# EasyEDA Pro project ProPrj_Solar MPPT Charger v4_2026-03-31.epro

# Schematic Solar Converter
Board Name: Solar Converter; Create Date: 2024-10-22; Page Name: Solar Converter; Project Name: Solar MPPT Charger v4; Schematic Name: Solar Converter; Update Date: 2024-10-26; Add into BOM: yes; Company: Your Company; Convert to PCB: yes; Date: 2020-07-08; Draw By: iqasi096; REV: 1.0; Sheet: 1/1
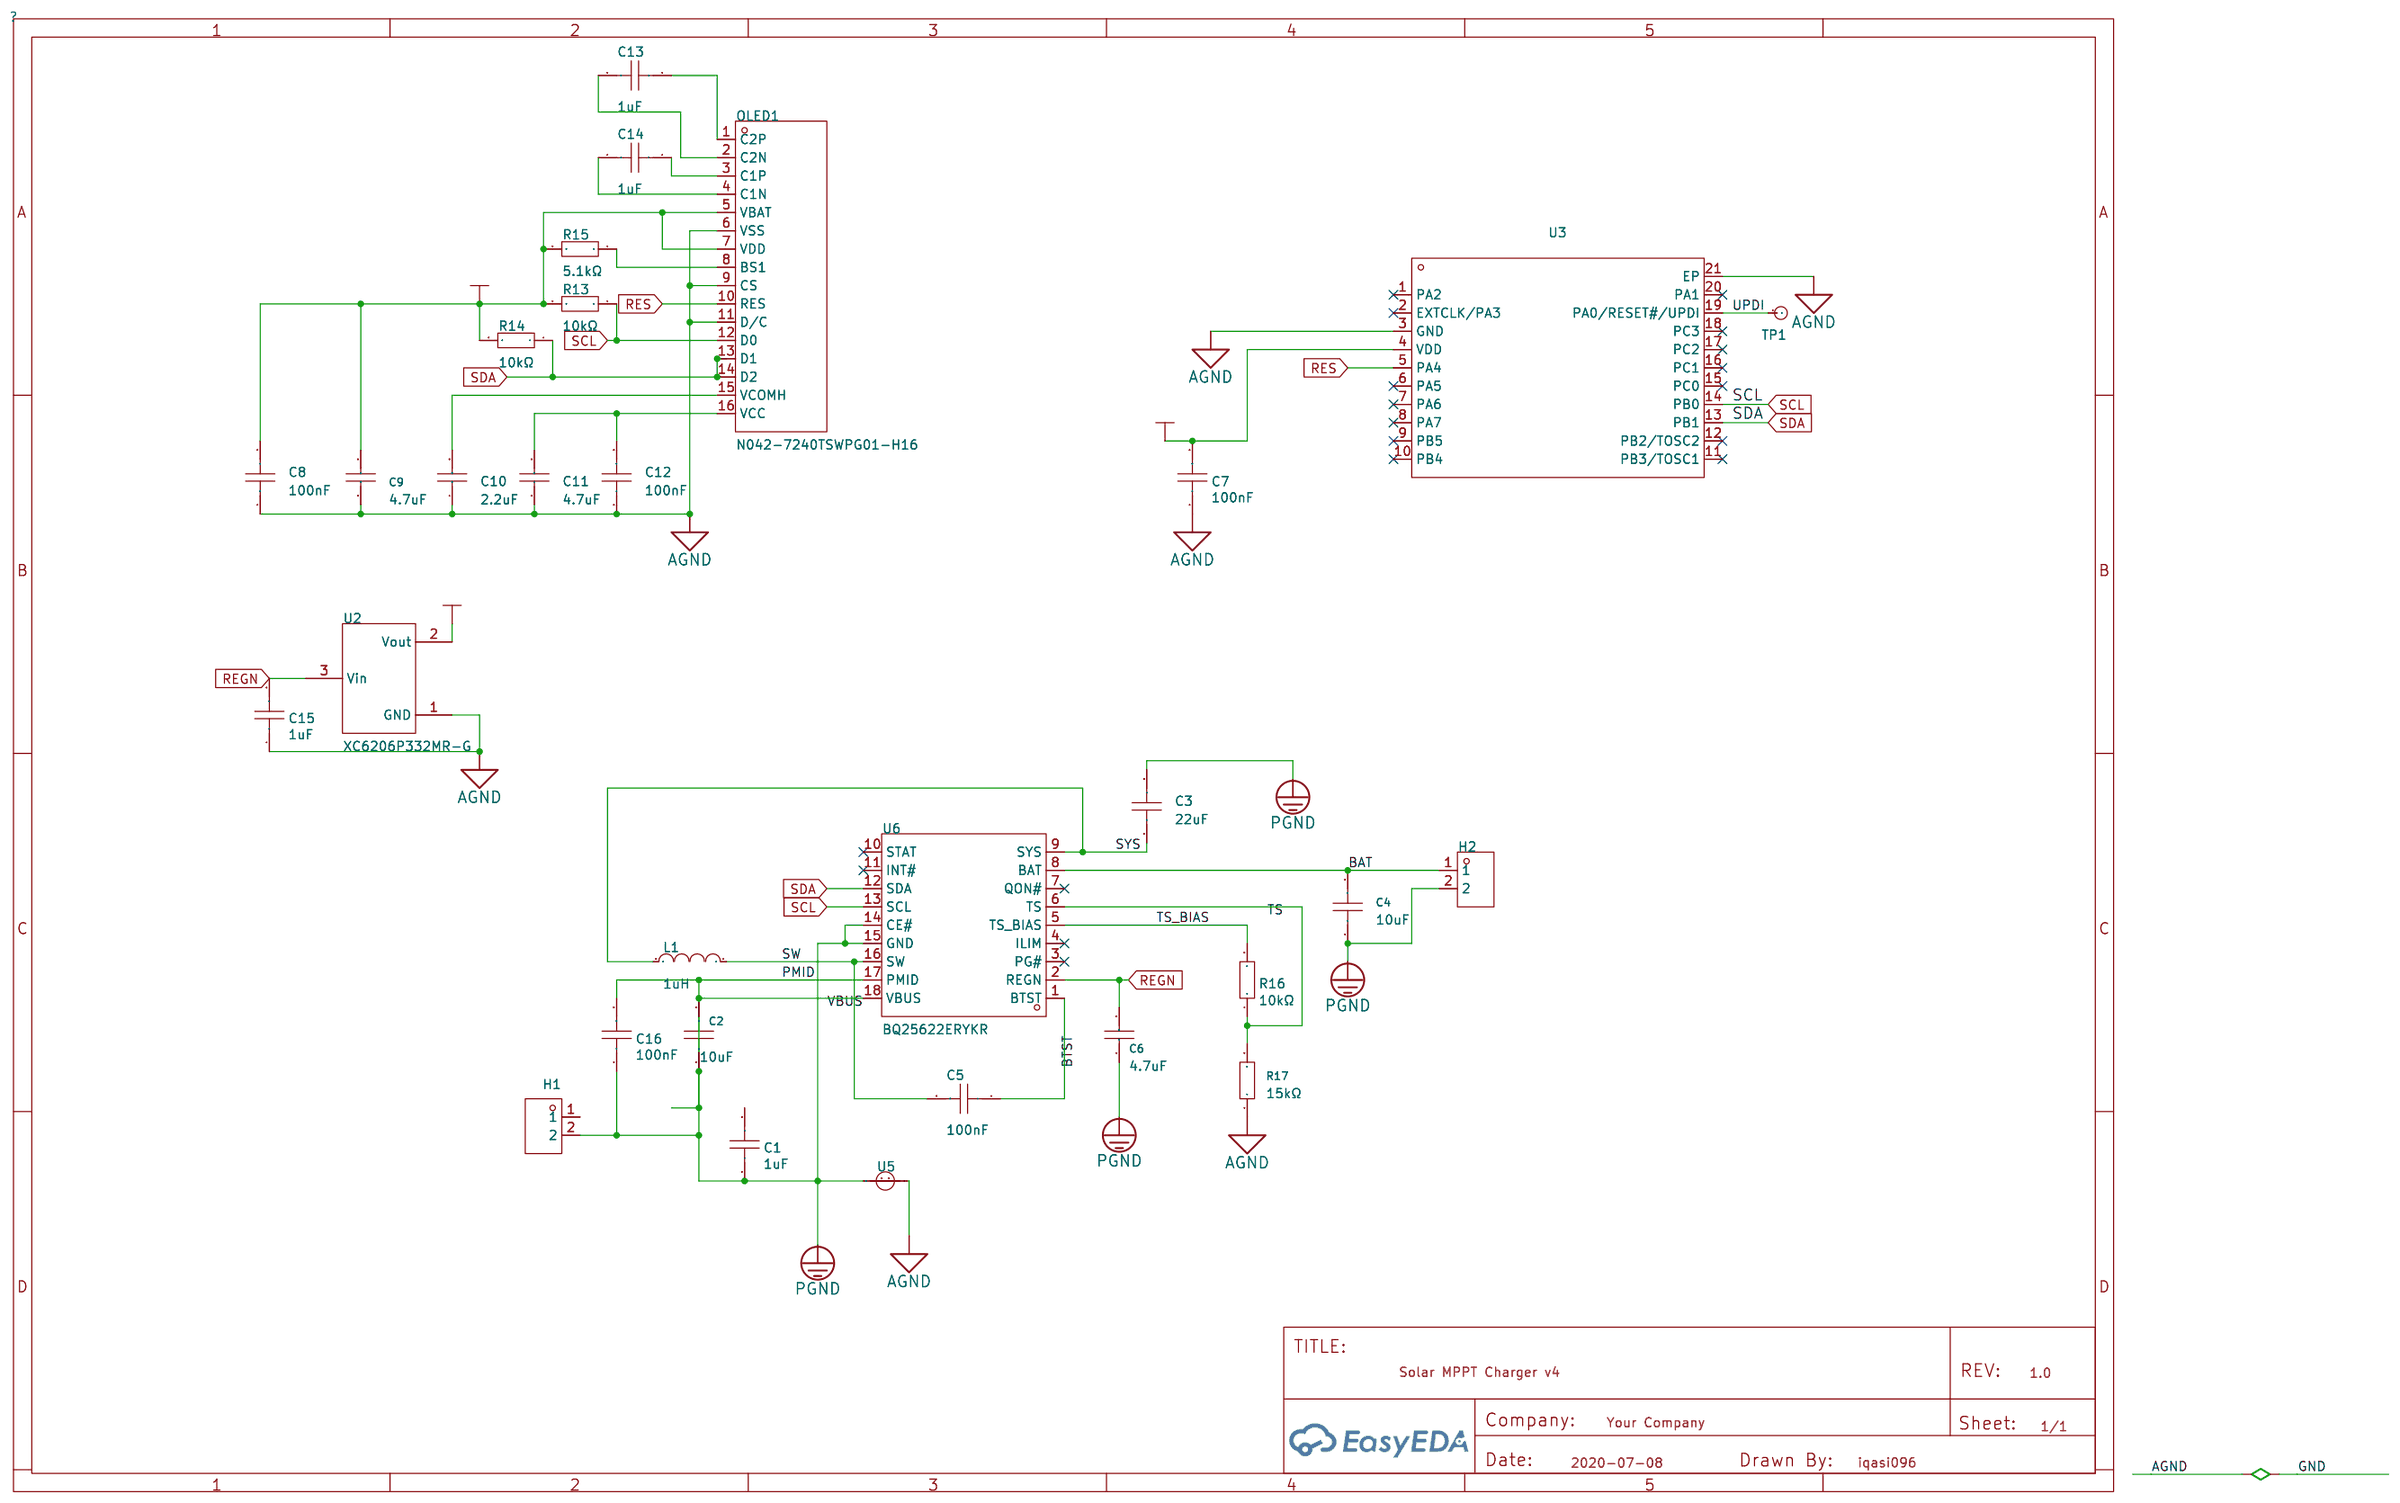
[diagram p0: schematic sheet]

## Parts
C1  1uF  [C0402]
C2  10uF  [C0603]
C3  22uF  [C0805]
C4  10uF  [C0603]
C5  100nF  [C0402]
C6  4.7uF  [C0402]
C7  100nF  [C0402]
C8  100nF  [C0402]
C9  4.7uF  [C0402]
C10  2.2uF  [C0603]
C11  4.7uF  [C0603]
C12  100nF  [C0402]
C13  1uF  [C0402]
C14  1uF  [C0402]
C15  1uF  [C0402]
C16  100nF  [C0402]
H1  SIP2-2.54MM双排针  [footprint_31f8]
H2  SIP2-2.54MM双排针  [footprint_31f8]
L1  1uH  [IND-SMD_L5.4-W5.2_SUMIDA_0530CDMCCDS]
OLED1  N042-7240TSWPG01-H16  [OLED-SMD_L23.0-W12.0_N042-7240TSWPG01-H16]
R13  10kΩ  [R0402]
R14  10kΩ  [R0402]
R15  5.1kΩ  [R0402]
R16  10kΩ  [R0402]
R17  15kΩ  [R0402]
TP1  TESTPOIN-SMD-Ø1.2MM  [footprint_b741]
U2  XC6206P332MR-G  [SOT-23-3_L2.9-W1.6-P1.90-LS2.8-BR]
U3  ATTINY1616-MNR  [footprint_6c4b]
U5  -  [short_keith]  (no BOM)
U6  BQ25622ERYKR  [WQFN-18_L3.0-W2.5-P0.40-TL]

## Library data of the parts
C1 C13-C15 = CL05A105KA5NQNC: Capacitance: Tolerance:±10% Tolerance:±10% Voltage Rated: Temperature Coefficient:; LCSC Part Name: 1uF ±10% 25V; Supplier Part: C52923; Manufacturer: SAMSUNG(三星); Supplier Footprint: 0402; JLCPCB Part Class: Basic Part; Datasheet: https://atta.szlcsc.com/upload/public/pdf/source/20160218/1457707763339.pdf; Supplier: LCSC; Tolerance: ±10%
C2 C4 = CL10A106MA8NRNC: Capacitance: Tolerance:±20% Tolerance:±20% Voltage Rated: Temperature Coefficient:; LCSC Part Name: 10uF ±20% 25V; Supplier Part: C96446; Manufacturer: SAMSUNG(三星); Supplier Footprint: 0603; JLCPCB Part Class: Basic Part; Datasheet: https://atta.szlcsc.com/upload/public/pdf/source/20160218/1457707763339.pdf; Supplier: LCSC; Tolerance: ±20%
C3 = CL21A226MAQNNNE: Capacitance: Tolerance:±20% Tolerance:±20% Voltage Rated: Temperature Coefficient:; LCSC Part Name: 22uF ±20% 25V; Supplier Part: C45783; Manufacturer: SAMSUNG(三星); Supplier Footprint: 0805; JLCPCB Part Class: Basic Part; Datasheet: https://atta.szlcsc.com/upload/public/pdf/source/20160218/1457707763339.pdf; Supplier: LCSC; Tolerance: ±20%
C5 = CL05B104KO5NNNC: Capacitance: Tolerance:±10% Tolerance:±10% Voltage Rated: Temperature Coefficient:; LCSC Part Name: 100nF ±10% 16V; Supplier Part: C1525; Manufacturer: SAMSUNG(三星); Supplier Footprint: 0402; JLCPCB Part Class: Basic Part; Datasheet: https://atta.szlcsc.com/upload/public/pdf/source/20160218/1457707763339.pdf; Supplier: LCSC; Tolerance: ±10%
C6 C9 = CL05A475MP5NRNC: Capacitance: Tolerance:±20% Tolerance:±20% Voltage Rated: Temperature Coefficient:; LCSC Part Name: 4.7uF ±20% 10V; Supplier Part: C23733; Manufacturer: SAMSUNG(三星); Supplier Footprint: 0402; JLCPCB Part Class: Basic Part; Datasheet: https://atta.szlcsc.com/upload/public/pdf/source/20160218/1457707763339.pdf; Supplier: LCSC; Tolerance: ±20%
C7 C8 C12 C16 = CL05B104KB54PNC: Capacitance: Tolerance:±10% Tolerance:±10% Voltage Rated: Temperature Coefficient:; LCSC Part Name: 100nF ±10% 50V; Supplier Part: C307331; Manufacturer: SAMSUNG(三星); Supplier Footprint: 0402; JLCPCB Part Class: Basic Part; Datasheet: https://atta.szlcsc.com/upload/public/pdf/source/20160218/1457707763339.pdf; Supplier: LCSC; Tolerance: ±10%
C10 = CL10A225KO8NNNC: Capacitance: Tolerance:±10% Tolerance:±10% Voltage Rated: Temperature Coefficient:; LCSC Part Name: 2.2uF ±10% 16V; Supplier Part: C23630; Manufacturer: SAMSUNG(三星); Supplier Footprint: 0603; JLCPCB Part Class: Basic Part; Datasheet: https://atta.szlcsc.com/upload/public/pdf/source/20160218/1457707763339.pdf; Supplier: LCSC; Tolerance: ±10%
C11 = CL10A475KO8NNNC: Capacitance: Tolerance:±10% Tolerance:±10% Voltage Rated: Temperature Coefficient:; LCSC Part Name: 4.7uF ±10% 16V; Supplier Part: C19666; Manufacturer: SAMSUNG(三星); Supplier Footprint: 0603; JLCPCB Part Class: Basic Part; Datasheet: https://atta.szlcsc.com/upload/public/pdf/source/20160218/1457707763339.pdf; Supplier: LCSC; Tolerance: ±10%
H1 H2 = SIP2-2.54MM双排针: Supplier: LCSC; Supplier Part: C9900003705; Manufacturer: null; Manufacturer Part: SIP2-2.54mm双排针; JLCPCB Part Class: Extended Part
L1 = 0530CDMCCDS-1R0MC: Inductance: Tolerance:±20% Tolerance:±20% Rated Current: Saturation Current (Isat):12A DC Resistance (DCR): Type:- Ratings:-; LCSC Part Name: 1uH ±20% 12A; Supplier Part: C2453584; Manufacturer: Sumida(胜美达); Supplier Footprint: SMD,5.4x5.2mm; JLCPCB Part Class: Extended Part; Datasheet: https://atta.szlcsc.com/upload/public/pdf/source/20200609/C596466_5BCDC523DFFDD55220635ED057F3408C.pdf; Supplier: LCSC; Tolerance: ±20%; Saturation Current (Isat): 12A
OLED1 = N042-7240TSWPG01-H16: Main Control Chip:SSD1315 Interface Type:I2C Size:0.42 Pixel Resolution:72x40 Operating Temperature:-40℃~+85℃ Operating Temperature:-40℃~+85℃; LCSC Part Name: 0.42寸 白光 72x40像素分辨率 16PIN; Supplier Part: C2890602; Manufacturer: Newvision(新智景); JLCPCB Part Class: Extended Part; Datasheet: https://atta.szlcsc.com/upload/public/pdf/source/20220616/8E4FF058E99944D2E326A1AA19D8CE74.pdf; Supplier: LCSC; Main Control Chip: SSD1315; Interface Type: I2C; Size: 0.42; Pixel Resolution: 72x40; Operating Temperature: -40℃~+85℃
R13 R14 R16 = 0402WGF1002TCE: Type:Thick Film Resistors Resistance:10kΩ Tolerance:±1% Tolerance:±1% Power(Watts): Overload Voltage (Max): Temperature Coefficient:±100ppm/℃ Temperature Coefficient:±100ppm/℃ Operating Temperature Range:-55℃~+155℃ Operating Temperature Range:-55℃~+155℃; LCSC Part Name: 10kΩ ±1% 62.5mW 厚膜电阻; Supplier Part: C25744; Manufacturer: UNI-ROYAL(厚声); Supplier Footprint: 0402; JLCPCB Part Class: Basic Part; Datasheet: https://atta.szlcsc.com/upload/public/pdf/source/20200306/C422600_1E6D84923E4A46A82E41ADD87F860B5C.pdf; Supplier: LCSC; Type: Thick Film Resistors; Tolerance: ±1%; Temperature Coefficient: ±100ppm/℃; Operating Temperature Range: -55℃~+155℃
R15 = 0402WGF5101TCE: Type:Thick Film Resistors Resistance:5.1kΩ Tolerance:±1% Tolerance:±1% Power(Watts): Overload Voltage (Max): Temperature Coefficient:±100ppm/℃ Temperature Coefficient:±100ppm/℃ Operating Temperature Range:-55℃~+155℃ Operating Temperature Range:-55℃~+155℃; LCSC Part Name: 5.1kΩ ±1% 62.5mW 厚膜电阻; Supplier Part: C25905; Manufacturer: UNI-ROYAL(厚声); Supplier Footprint: 0402; JLCPCB Part Class: Basic Part; Datasheet: https://atta.szlcsc.com/upload/public/pdf/source/20200306/C422600_1E6D84923E4A46A82E41ADD87F860B5C.pdf; Supplier: LCSC; Type: Thick Film Resistors; Tolerance: ±1%; Temperature Coefficient: ±100ppm/℃; Operating Temperature Range: -55℃~+155℃
R17 = 0402WGF1502TCE: Type:Thick Film Resistors Resistance:15kΩ Tolerance:±1% Tolerance:±1% Power(Watts): Overload Voltage (Max): Temperature Coefficient:±100ppm/℃ Temperature Coefficient:±100ppm/℃ Operating Temperature Range:-55℃~+155℃ Operating Temperature Range:-55℃~+155℃; LCSC Part Name: 15kΩ ±1% 62.5mW 厚膜电阻; Supplier Part: C25756; Manufacturer: UNI-ROYAL(厚声); Supplier Footprint: 0402; JLCPCB Part Class: Basic Part; Datasheet: https://atta.szlcsc.com/upload/public/pdf/source/20200306/C422600_1E6D84923E4A46A82E41ADD87F860B5C.pdf; Supplier: LCSC; Type: Thick Film Resistors; Tolerance: ±1%; Temperature Coefficient: ±100ppm/℃; Operating Temperature Range: -55℃~+155℃
TP1 = TESTPOIN-SMD-Ø1.2MM
U2 = XC6206P332MR-G_C5446: Output Type: Maximum Input Voltage:6V Output Voltage:3.3V Output Voltage:3.3V MAX Output Current:200mA Power Supply Rejection Ratio (PSRR):- Dropout Voltage:680mV@(100mA) Output Polarity:Positive electrode Number of Outputs:1; LCSC Part Name: 输入6V 输出3.3V 200mA; Supplier Part: C5446; Manufacturer: TOREX(特瑞仕); Supplier Footprint: SOT-23-3L; JLCPCB Part Class: Basic Part; Datasheet: https://atta.szlcsc.com/upload/public/pdf/source/20130823/1457706639850.pdf; Supplier: LCSC; Maximum Input Voltage: 6V; Output Voltage: 3.3V; MAX Output Current: 200mA; Dropout Voltage: 680mV@(100mA); Output Polarity: Positive electrode; Number of Outputs: 1
U3 = ATTINY1616-MNR: CPU Core:AVR Program Storage Size:16KB RAM Size:2KB GPIO Ports Number:18 Operating Voltage Range:1.8V~5.5V Operating Voltage Range:1.8V~5.5V CPU Maximum Speed:20MHz Program Memory Type:FLASH Operating Temperature Range:-40℃~+105℃ Operating Temperature Ran; Supplier Part: C507118; Manufacturer: MICROCHIP(美国微芯); Supplier Footprint: QFN-20-EP(3x3); JLCPCB Part Class: Extended Part; Datasheet: https://atta.szlcsc.com/upload/public/pdf/source/20200402/C507118_C9B3D13493A25E1DA778A35EE1D23665.pdf; Supplier: LCSC; CPU Core: AVR; Program Storage Size: 16KB; RAM Size: 2KB; GPIO Ports Number: 18; Operating Voltage Range: 1.8V~5.5V; CPU Maximum Speed: 20MHz; Program Memory Type: FLASH; Operating Temperature Range: -40℃~+105℃; ADC (Bit): 10bit; DAC (Bit): 8bit; Peripheral/Function: WDT；PWM; Watchdog: 有; Infrared Data Association: 有; Low-Voltage Detect: 有; Internal Oscillator: 有
U5 = short_small
U6 = BQ25622ERYKR: Supplier Part: C17702457; Manufacturer: TI(德州仪器); Supplier Footprint: WQFN-18(3x2.5); JLCPCB Part Class: Extended Part; Datasheet: https://www.ti.com/cn/lit/gpn/bq25622e; Supplier: LCSC

## Nets
AGND: C1.1 C2.1 C2.2 C3.2 C4.1 C6.1 C7.1 C8.1 C9.1 C10.1 C11.1 C12.1 C15.1 C16.1 C16.2 H1.2 H2.2 OLED1.6(VSS) OLED1.9(CS) OLED1.11(D/C) R17.1 U2.1(GND) U3.3(GND) U3.21(EP) U5.1 U5.2 U6.14(CE#) U6.15(GND) U6.17(PMID) U6.18(VBUS)
VDD: C7.2 C8.2 C9.2 OLED1.5(VBAT) OLED1.7(VDD) R13.2 R14.2 R15.2 U2.2(Vout) U3.4(VDD)
BAT: C4.2 H2.1 U6.8(BAT)
BTST: C5.1 U6.1(BTST)
REGN: C6.2 C15.2 U2.3(Vin) U6.2(REGN)
RES: OLED1.10(RES) U3.5(PA4)
SCL: OLED1.12(D0) R13.1 U3.14(PB0) U6.13(SCL)
SDA: OLED1.13(D1) OLED1.14(D2) R14.1 U3.13(PB1) U6.12(SDA)
SW: C5.2 L1.2 U6.16(SW)
SYS: C3.1 L1.1 U6.9(SYS)
TS: R16.1 R17.2 U6.6(TS)
TS_BIAS: R16.2 U6.5(TS_BIAS)
UPDI: TP1.1 U3.19(PA0/RESET#/UPDI)
$1N11030: OLED1.8(BS1) R15.1
$1N11114: C14.2 OLED1.4(C1N)
$1N11119: C14.1 OLED1.3(C1P)
$1N11125: C13.2 OLED1.2(C2N)
$1N11133: C13.1 OLED1.1(C2P)
$1N11196: C11.2 C12.2 OLED1.16(VCC)
$1N11213: C10.2 OLED1.15(VCOMH)

Not connected (* = marked no-connect by the designer): C1 2; H1 1; U3 1(PA2)* 2(EXTCLK/PA3)* 6(PA5)* 7(PA6)* 8(PA7)* 9(PB5)* 10(PB4)* 11(PB3/TOSC1)* 12(PB2/TOSC2)* 15(PC0)* 16(PC1)* 17(PC2)* 18(PC3)* 20(PA1)*; U6 3(PG#)* 4(ILIM)* 7(QON#)* 10(STAT)* 11(INT#)*

# Board Solar Converter
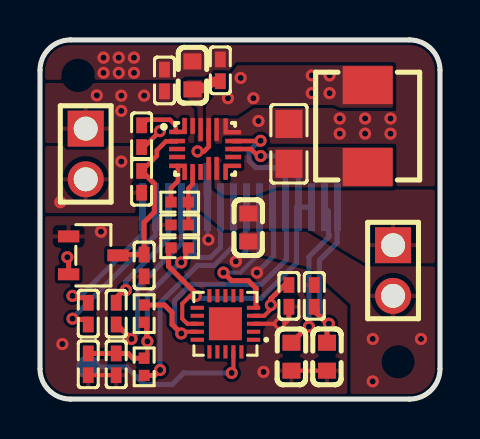
[diagram p1: board, top side]
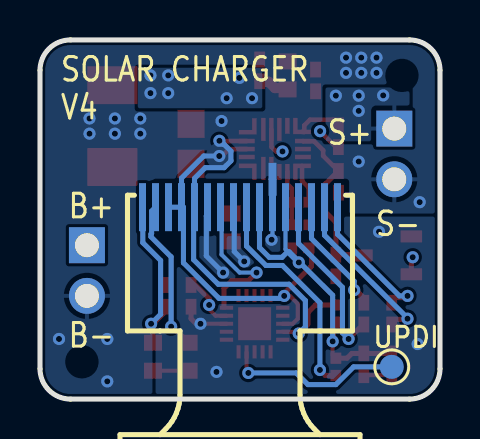
[diagram p2: board, bottom side, seen from below]

Outline 20 x 18 mm; copper layers: Top Layer, Inner1, Inner2, Bottom Layer. Coordinates in mm from the lower left corner of the outline.
Outline path: 0,16.47 0,1.52 arc(0.45,0.45) 1.52,0 18.48,0 arc(19.55,0.45) 20,1.52 20,16.47 arc(19.55,17.55) 18.48,18 1.52,18 arc(0.45,17.55) 0,16.47
Stack: Top Layer 0.035mm 外层铜厚1oz / Dielectric1 0.28mm 7628 RC49% 8.6mil / Inner1 0.035mm 内层铜厚 / Dielectric2 0.28mm 1.1mm H/HOZ 含铜 / Inner2 0.035mm 内层铜厚 / Dielectric3 0.28mm 7628 RC49% 8.6mil / Bottom Layer 0.035mm 外层铜厚1oz

## Design rules (mm)
template: User Custom Config
spacing Default (default): track to track 0.152, other pairs 0 to 0.152
spacing Slim: track to track 0.152, other pairs 0 to 0.152
track width Default (default): min 0.127, default 0.127, max 25.4
track width Slim: min 0.127, default 0.127, max 25.4
differential pair differentialPair (default): width min 0.127, default 0.254, max 2.54; gap min 0.152, default 0.152
via Default (default): diameter min 0.305, default 0.305, max 100.025; hole min 0.152, default 0.152, max 59.995
via Slim: diameter min 0.305, default 0.305, max 100.025; hole min 0.152, default 0.152, max 59.995

## Placement (name value [footprint] x y rotation side)
C1  1uF  [C0402]  6.22 15.97 270 top
C2  10uF  [C0603]  7.62 16.22 270 top
C3  22uF  [C0805]  12.45 12.79 90 top
C4  10uF  [C0603]  10.41 8.6 90 top
C5  100nF  [C0402]  5.08 13.17 270 top
C6  4.7uF  [C0402]  5.08 10.89 90 top
C7  100nF  [C0402]  12.45 5.17 90 top
C8  100nF  [C0402]  3.81 1.74 90 top
C9  4.7uF  [C0402]  2.41 1.74 90 top
C10  2.2uF  [C0603]  12.57 2.12 90 top
C11  4.7uF  [C0603]  14.35 2.12 90 top
C12  100nF  [C0402]  13.72 5.17 270 top
C13  1uF  [C0402]  2.41 4.28 270 top
C14  1uF  [C0402]  3.81 4.28 270 top
C15  1uF  [C0402]  5.21 6.7 90 top
C16  100nF  [C0402]  9.02 16.47 270 top
H1  SIP2-2.54MM双排针  [footprint_31f8]  2.29 12.28 180 top
H2  SIP2-2.54MM双排针  [footprint_31f8]  17.65 6.44 180 top
L1  1uH  [IND-SMD_L5.4-W5.2_SUMIDA_0530CDMCCDS]  16.38 13.68 90 top
OLED1  N042-7240TSWPG01-H16  [OLED-SMD_L23.0-W12.0_N042-7240TSWPG01-H16]  10 9.62 0 bottom
R13  10kΩ  [R0402]  5.21 4.28 270 top
R14  10kΩ  [R0402]  6.99 7.58 0 top
R15  5.1kΩ  [R0402]  5.21 1.62 90 top
R16  10kΩ  [R0402]  6.99 9.87 180 top
R17  15kΩ  [R0402]  6.99 8.73 0 top
U2  XC6206P332MR-G  [SOT-23-3_L2.9-W1.6-P1.90-LS2.8-BR]  2.67 7.2 180 top
U3  ATTINY1616-MNR  [footprint_6c4b]  9.27 3.77 90 top
U5  -  [short_keith]  8.37 11.01 270 bottom
U6  BQ25622ERYKR  [WQFN-18_L3.0-W2.5-P0.40-TL]  8.25 12.54 0 top
UPDI  TESTPOIN-SMD-Ø1.2MM  [footprint_b741]  2.41 1.62 180 bottom

## Footprints (pads in the part's own frame, mm; a bottom-side part is the same pattern mirrored in y, then rotated)
C0402
  rect 0.79x0.54 smd: 1(-0.545,0) 2(0.545,0)
C0603
  rect 0.8x0.9 smd: 1(-0.7,0) 2(0.7,0)
C0805
  rect 1.41x1.35 smd: 1(-1,0) 2(1,0)
footprint_6c4b
  rect 0.2x0.665 smd: 1(-0.8,-1.407) 2(-0.4,-1.407) 3(0,-1.407) 4(0.4,-1.407) 5(0.8,-1.407) 11(0.8,1.407) 12(0.4,1.407) 13(0,1.407) 14(-0.4,1.407) 15(-0.8,1.407)
  rect 0.665x0.2 smd: 6(1.407,-0.8) 7(1.407,-0.4) 8(1.407,0) 9(1.407,0.4) 10(1.407,0.8) 16(-1.407,0.8) 17(-1.407,0.4) 18(-1.407,0) 19(-1.407,-0.4) 20(-1.407,-0.8)
  rect 1.65x1.65 smd: 21(0,0)
footprint_31f8
  rect 1.8x1.8 hole 1.2: 1(0,-1.27)
  round 1.8 hole 1.2: 2(0,1.27)
footprint_b741
  round 1.2 smd: 1(0,0)
IND-SMD_L5.4-W5.2_SUMIDA_0530CDMCCDS
  rect 1.9x2.5 smd: 1(-2.05,0) 2(2.05,0)
OLED-SMD_L23.0-W12.0_N042-7240TSWPG01-H16
  rect 0.35x2.4 smd: 1(-4.875,0) 2(-4.225,0) 3(-3.575,0) 4(-2.925,0) 5(-2.275,0) 6(-1.625,0) 7(-0.975,0) 8(-0.325,0) 9(0.325,0) 10(0.975,0) 11(1.625,0) 12(2.275,0) 13(2.925,0) 14(3.575,0) 15(4.225,0) 16(4.875,0)
R0402
  rect 0.566x0.54 smd: 1(-0.433,0) 2(0.433,0)
short_keith
  rect 0.85x0.4 smd: 1(-0.4,0) 2(0.4,0)
SOT-23-3_L2.9-W1.6-P1.90-LS2.8-BR
  rect 1.07x0.6 smd: 1(1.235,-0.95) 2(1.235,0.95) 3(-1.235,0)
WQFN-18_L3.0-W2.5-P0.40-TL
  custom 0.889x0.814 smd: 1(-1.357,0.85) 5(-1.357,-0.85) 10(1.357,-0.85) 14(1.357,0.836)
  rect 0.795x0.224 smd: 2(-1.403,0.393) 3(-1.403,-0.007) 4(-1.403,-0.407) 11(1.403,-0.407) 12(1.403,-0.007) 13(1.403,0.393)
  rect 0.224x0.795 smd: 6(-0.625,-1.153) 7(-0.225,-1.153) 18(-0.625,1.153)
  rect 0.224x1.15 smd: 8(0.175,-0.976) 9(0.575,-0.976) 15(0.575,0.976) 16(0.175,0.977) 17(-0.225,0.977)

## Nets
AGND: C7.1 C8.1 C9.1 C10.1 C11.1 C12.1 C15.1 OLED1.6 OLED1.9 OLED1.11 R17.1 U2.1 U3.3 U3.21 U5.2
PGND: C1.1 C2.1 C3.2 C4.1 C6.1 C16.1 H1.2 H2.2 U5.1 U6.14 U6.15
VBUS: C1.2 H1.1 U6.18
VDD: C7.2 C8.2 C9.2 OLED1.5 OLED1.7 R13.2 R14.2 R15.2 U2.2 U3.4
BAT: C4.2 H2.1 U6.8
BTST: C5.1 U6.1
PMID: C2.2 C16.2 U6.17
REGN: C6.2 C15.2 U2.3 U6.2
RES: OLED1.10 U3.5
SCL: OLED1.12 R13.1 U3.14 U6.13
SDA: OLED1.13 OLED1.14 R14.1 U3.13 U6.12
SW: C5.2 L1.2 U6.16
SYS: C3.1 L1.1 U6.9
TS: R16.1 R17.2 U6.6
TS_BIAS: R16.2 U6.5
UPDI: U3.19 UPDI.1
$1N11030: OLED1.8 R15.1
$1N11114: C14.2 OLED1.4
$1N11119: C14.1 OLED1.3
$1N11125: C13.2 OLED1.2
$1N11133: C13.1 OLED1.1
$1N11196: C11.2 C12.2 OLED1.16
$1N11213: C10.2 OLED1.15

Pads without a net: U3 1 2 6 7 8 9 10 11 12 15 16 17 18 20; U6 3 4 7 10 11

## Via types
v1: diameter 0.61, hole 0.305, Top Layer to Bottom Layer, 55 vias

## Routing (per net, layer and track width the routed paths; a pad name or vN(x,y) marks a point on that pad's centre or on a via; arc(x,y) is an arc through that point)
AGND: length 13.9
  Top Layer w0.203: C10.1 C11.1 ; C9.1 C8.1 ; v1(11.98,3.77) U3.3
  Top Layer w0.254: v1(11.98,3.77) 12.19,3.77 12.45,4.03 C7.1
  Bottom Layer w0.203: OLED1.6 8.38,8.03 v1(8.42,7.99)
  Bottom Layer w0.254: v1(9.79,6.9) 10.29,7.4 10.29,9.58 OLED1.9 ; OLED1.11 11.62,9.24 11.68,9.18 11.68,7.18 v1(10.85,6.34)
  vias: v1(1.12,2.76) v1(3.05,8.39) v1(11.18,1.36)
PGND:
  vias: v1(1.02,9.87) v1(3.18,17.11) v1(3.18,16.35) v1(3.94,17.11) v1(3.94,16.35) v1(4.06,11.9) v1(4.7,17.11) v1(4.7,16.35) v1(10.92,13.93) v1(14.99,14.06) v1(14.99,13.3) v1(16.26,14.06) v1(16.26,13.3) v1(16.64,3.01) v1(16.64,0.89) v1(17.53,14.06) v1(17.53,13.3) v1(19.05,3.01)
VBUS:
  vias: v1(2.84,15.22) v1(4.06,15.2) v1(4.06,14.44) v1(5.21,15.2)
VDD: length 21.5
  Top Layer w0.203: v1(11.54,4.72) 11.54,4.5 11.21,4.17 U3.4 ; v1(5.37,2.89) 5.37,2.21 R15.2
  Top Layer w0.254: v1(1.37,7.11) 1.43,7.04 U2.2 ; C9.2 C8.2 4.41,2.29 4.65,2.05 R15.2 ; 7.07,6.84 7.29,7.07 7.29,7.58 ; v1(5.37,2.89) 5.33,2.93 5.33,3.85 ; C7.2 12.23,5.72 11.54,5.03 v1(11.54,4.72)
  Bottom Layer w0.203: OLED1.5 7.72,7.5 7.61,7.38
  Bottom Layer w0.254: 7.62,7.38 7.54,7.38 5.37,5.21 v1(5.37,2.89) ; 7.62,7.38 7.08,6.84 7.07,6.84 ; 7.62,7.38 7.9,7.1 8.53,7.1 9.03,7.59 OLED1.7
  vias: v1(7.06,6.85)
(no net): length 1.3
  Inner2 w0.203: 12.47,7.56 12.47,7.76 12.14,7.44 12.14,7.23 12.47,7.56
BTST: length 2.4
  Top Layer w0.229: U6.1 6.79,13.39 6.79,13.71 6.5,14 5.36,14 C5.1
PMID: length 1.6
  Top Layer w0.508: C2.2 7.69,15.59 8.25,15.59 8.57,15.9 8.86,15.9 8.89,15.93 C16.2
REGN: length 8.5
  Top Layer w0.229: C6.2 5.84,12.19 5.84,12.46 6.3,12.92 6.84,12.92 U6.2
  Top Layer w0.254: U2.3 3.94,7.24 C15.2 5.21,8.85 5.72,9.36 5.72,10.8 C6.2
RES: length 7.4
  Top Layer w0.254: v1(9.17,6.34) 9.58,5.93 10.41,5.93 10.8,5.54 10.8,4.61
  Bottom Layer w0.203: v1(9.17,6.34) 10.02,6.34 10.92,7.24 10.92,9.56 OLED1.10
SCL: length 20.8
  Top Layer w0.203: U3.14 7.15,3.37 v1(7.06,3.29)
  Top Layer w0.229: U6.13 11.02,12.93 v1(11.03,12.94)
  Top Layer w0.254: v1(7.06,3.29) 6.6,3.75 6.6,4.33 6.22,4.72 5.21,4.72
  Bottom Layer w0.254: v1(7.06,3.29) 6.73,3.62 6.73,4.94 7.55,5.76 11.09,5.76 12.32,6.99 12.32,9.36 12.28,9.41 OLED1.12 12.28,11.06 11.74,11.6 10.79,11.6 10.45,11.94 10.45,12.42 10.79,12.76 10.85,12.76 v1(11.03,12.94)
SDA: length 20.1
  Top Layer w0.203: U3.13 7.37,3.77 7.11,4.03 7.11,4.78 7.5,5.17 v1(7.79,5.17)
  Top Layer w0.229: U6.12 10.55,12.53 10.9,12.18 v1(11.04,12.18)
  Top Layer w0.254: v1(7.79,5.17) 7.79,5.29 6.48,6.61 6.48,6.61 6.43,6.66 6.43,7.58
  Bottom Layer w0.254: OLED1.13 12.83,9.62 12.83,6.83 11.04,5.04 7.92,5.04 v1(7.79,5.17) ; OLED1.13 12.93,11.07 11.82,12.18 v1(11.04,12.18) ; OLED1.13 OLED1.14
SW: length 5.1
  Top Layer w0.229: v1(6,13.43) 5.2,12.63 C5.2 ; U6.16 8.43,12.64 8.2,12.41 v1(7.88,12.41)
  Inner2 w0.229: v1(7.88,12.41) 6.86,13.43 v1(6,13.43)
  vias: v1(9.4,15.08) v1(10.03,16.09) v1(10.67,15.08) v1(13.59,16.22) v1(13.59,15.33) v1(14.48,16.22) v1(14.48,15.33)
TS: length 2.7
  Top Layer w0.229: R17.2 R16.1 7.42,10.56 7.63,10.77 U6.6
TS_BIAS: length 2
  Top Layer w0.229: R16.2 6.55,10.58 6.9,10.93 U6.5
UPDI: length 8.9
  Top Layer w0.203: U3.19 9.67,1.4 v1(9.58,1.31)
  Bottom Layer w0.254: v1(9.58,1.31) 7.19,1.31 6.6,0.73 5.21,0.73 4.32,1.62 UPDI.1
$1N11030: length 11.1
  Top Layer w0.254: R15.1 5.73,1.18 v1(6,1.46)
  Bottom Layer w0.254: v1(6,1.46) 6,4.83 7.87,6.7 8.7,6.7 9.68,7.67 OLED1.8
$1N11114: length 8.9
  Top Layer w0.254: 3.81,3.99 3.81,3.77 v1(4.57,3.01)
  Bottom Layer w0.254: v1(4.57,3.01) 4.88,3.32 4.88,5.6 7.07,7.8 OLED1.4
$1N11119: length 5.7
  Top Layer w0.254: v1(4.29,5.46) 4.19,5.46 3.81,5.08
  Bottom Layer w0.254: OLED1.3 6.43,8.04 4.29,5.91 v1(4.29,5.46)
$1N11125: length 8.2
  Top Layer w0.254: 2.41,3.99 1.66,3.99 v1(1.63,4.03)
  Bottom Layer w0.254: 1.55,4.03 1.59,4.03 5.78,8.21 OLED1.2
$1N11133: length 7
  Top Layer w0.254: v1(1.62,5.17) 1.71,5.08 2.41,5.08
  Bottom Layer w0.254: v1(1.62,5.17) 2.03,5.17 5.12,8.26 OLED1.1
$1N11196: length 8.6
  Top Layer w0.254: C12.2 13.84,4.5 13.84,4.28 14.35,3.77 v1(14.44,3.77) 14.35,3.68 C11.2
  Bottom Layer w0.254: OLED1.16 14.86,9.6 14.86,7.84 13.97,6.95 13.97,4.25 v1(14.44,3.77)
$1N11213: length 7.7
  Top Layer w0.254: C10.2 13.38,3.63 v1(13.44,3.63)
  Bottom Layer w0.254: v1(13.44,3.63) 13.44,7.13 14.45,8.14 14.45,8.27 14.42,8.3 14.42,9.42 14.22,9.62

## Copper pours and planes (outline as drawn; the poured copper is in the pictures)
AGND on Top Layer: 0,9.17 4.93,9.17 4.93,10.82 15.37,10.82 15.37,-0.04 0,-0.04
AGND on Bottom Layer: 0.13,9.14 4.7,9.14 4.7,10.89 14.22,10.89 14.22,-0.04 0.13,-0.04
AGND on Inner1: -0.12,9.24 4.45,9.24 4.45,10.86 15.25,10.86 15.25,-0.07 -0.12,-0.07
PGND on Top Layer: 20.07,-0.04 20.07,6.55 16.38,6.55 13.31,8.39 10,8.39 10,7.51 13.46,6.6 15.75,4.54 15.75,-0.04
PGND on Top Layer: 8.73,14.05 9.9,14.05 10.7,14.58 14.62,14.58 14.99,14.44 18.92,14.44 18.92,12.79 8.73,12.79
PGND on Top Layer: 0,18 20.07,18 20.07,-0.04 0,-0.04
PGND on Bottom Layer: 0,18 19.94,18 19.94,0.09 0,0.09
PGND on Inner1: -0.13,18 19.94,18 19.94,-0.04 -0.13,-0.04
PGND on Inner2: 0,18 20.07,18 20.07,-0.04 0,-0.04
VBUS on Top Layer: 0,15.84 0,12.83 8.11,12.83 8.11,15.84
VBUS on Bottom Layer: 1.52,15.61 5.72,15.61 5.72,12.92 1.52,12.92
VDD on Inner2: 0.11,9.11 4.43,9.11 4.43,10.98 15.47,10.98 15.47,0.06 0.11,0.06
BAT on Top Layer: 20,10.51 20,6.8 16.24,6.8 13.38,8.48 9.18,8.48 7.84,9.61 7.84,11.93 11.8,11.93 11.8,11.16 14.84,11.16 14.84,10.51
PMID on Top Layer: 7.3,16 7.3,15.09 7.35,15.09 7.87,14.57 7.87,12.86 8.15,12.86 8.15,16
SW on Top Layer: 8.25,12.92 17.65,12.92 17.65,16.73 9.87,16.73 8.25,14.62
SW on Bottom Layer: 8.89,16.6 15.11,16.6 15.11,14.57 8.89,14.57
SYS on Top Layer: 9.85,12.93 14.22,12.93 14.48,12.66 17.66,12.66 17.66,10.61 11.86,10.61 10.74,10.22 9.2,10.22 8.73,10.56 8.73,12.09 9.85,12.02

Small or netless copper shapes (teardrops, artwork), in the pictures only: 1 on Inner2

## Text on the board
Bottom Silkscreen Layer: B+ | B- | SOLAR CHARGER / V4 | S- | S+
